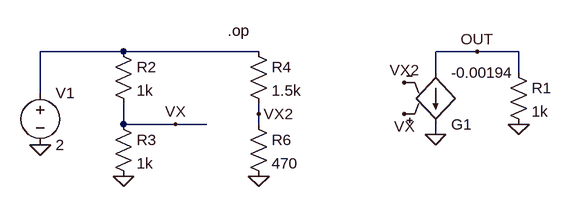
[diagram p0: schematic lt_test_gsource.asc]
lt_test_gsource.asc, the LTspice schematic file:
Version 4.1
SHEET 1 880 680
WIRE 80 32 -48 32
WIRE 288 32 80 32
WIRE 624 32 560 32
WIRE 688 32 624 32
WIRE 560 64 560 32
WIRE 688 64 688 32
WIRE -48 96 -48 32
WIRE 288 128 288 112
WIRE 80 144 80 112
WIRE 160 144 80 144
WIRE 208 144 160 144
WIRE 288 144 288 128
WIRE 560 160 560 144
FLAG 80 224 0
FLAG 688 144 0
FLAG -48 176 0
FLAG 624 32 OUT
FLAG 160 144 VX
FLAG 288 224 0
FLAG 288 128 VX2
FLAG 560 160 0
FLAG 512 80 VX2
FLAG 512 128 VX
SYMBOL res 672 48 R0
SYMATTR InstName R1
SYMATTR Value 1k
SYMBOL res 64 16 R0
SYMATTR InstName R2
SYMATTR Value 1k
SYMBOL res 64 128 R0
SYMATTR InstName R3
SYMATTR Value 1k
SYMBOL voltage -48 80 R0
WINDOW 123 0 0 Left 0
WINDOW 39 0 0 Left 0
SYMATTR InstName V1
SYMATTR Value 2
SYMBOL res 272 16 R0
SYMATTR InstName R4
SYMATTR Value 1.5k
SYMBOL res 272 128 R0
SYMATTR InstName R6
SYMATTR Value 470
SYMBOL g 560 160 M180
SYMATTR InstName G1
SYMATTR Value -0.00194
TEXT 240 0 Left 2 !.op

The netlist it stands for:
* lt_test_gsource.asc
R1 OUT 0 1k
R2 N001 VX 1k
R3 VX 0 1k
V1 N001 0 2
R4 N001 VX2 1.5k
R6 VX2 0 470
G1 OUT 0 VX VX2 -0.00194
.op
.backanno
.end